# Altium schematic sheet LM386.SchDoc
size A; SheetNumber: 1; SheetTotal: 1
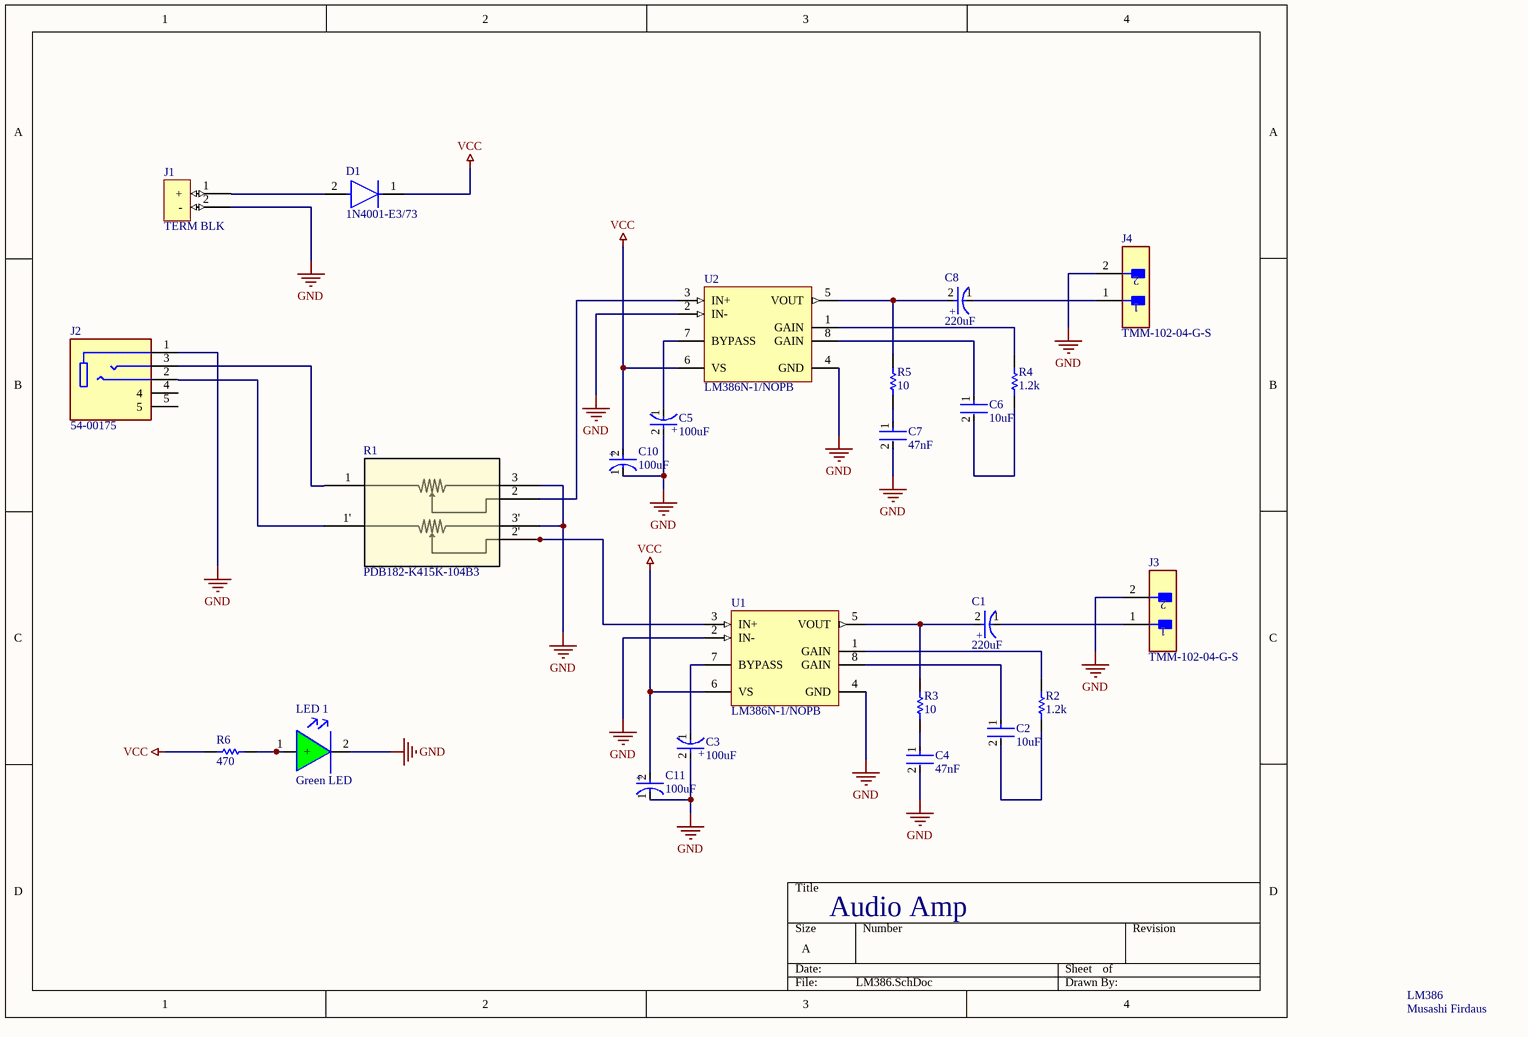
[diagram p0: LM386.SchDoc]

## Parts
C1  220uF  [FP-RAD-TH-D_10_0_5-L_12_5-MFG]
C2  10uF  [FP-RHE2DB-MFG]
C3  100uF  [FP-RAD-TH-D_10_0_5-L_12_5-MFG]
C4  47nF  [FP-RHE2DB-MFG]
C5  100uF  [FP-RAD-TH-D_10_0_5-L_12_5-MFG]
C6  10uF  [FP-RHE2DB-MFG]
C7  47nF  [FP-RHE2DB-MFG]
C8  220uF  [FP-RAD-TH-D_10_0_5-L_12_5-MFG]
C10  100uF  [FP-RAD-TH-D_10_0_5-L_12_5-MFG]
C11  100uF  [FP-RAD-TH-D_10_0_5-L_12_5-MFG]
D1  1N4001-E3/73  [FP-1N4001-E3-73-MFG]
J1  TERM BLK  [Term Block]
J2  54-00175  [TENSILITY_54-00175]
J3  TMM-102-04-G-S  [FP-TMM-102-04-G-S-MFG]
J4  TMM-102-04-G-S  [FP-TMM-102-04-G-S-MFG]
LED_1  Green LED  [Green LED]
R1  PDB182-K415K-104B3  [POT_PDB182_BRN]
R2  1.2k  [RESA60-630X240]
R3  10  [RESA60-630X240]
R4  1.2k  [RESA60-630X240]
R5  10  [RESA60-630X240]
R6  470  [RESA60-630X240]
U1  LM386N-1/NOPB  [P0008A]
U2  LM386N-1/NOPB  [P0008A]

## Nets
GND: C3.2(A) C4.2 C5.2(A) C7.2 C10.1(C) C11.1(C) J1.2(-) J2.1 J3.2 J4.2 LED_1.2(-) R1.3 R1.3' U1.2(IN-) U1.4(GND) U2.2(IN-) U2.4(GND)
VCC: C10.2(A) C11.2(A) D1.1(C) R6.2 U1.6(VS) U2.6(VS)
NetC1_1: C1.1(C) J3.1
NetC1_2: C1.2(A) R3.2 U1.5(VOUT)
NetC2_1: C2.1 U1.8(GAIN)
NetC2_2: C2.2 R2.1
NetC3_1: C3.1(C) U1.7(BYPASS)
NetC4_1: C4.1 R3.1
NetC5_1: C5.1(C) U2.7(BYPASS)
NetC6_1: C6.1 U2.8(GAIN)
NetC6_2: C6.2 R4.1
NetC7_1: C7.1 R5.1
NetC8_1: C8.1(C) J4.1
NetC8_2: C8.2(A) R5.2 U2.5(VOUT)
NetD1_2: D1.2(A) J1.1(+)
NetJ2_2: J2.2 R1.1'
NetJ2_3: J2.3 R1.1
NetLED_1_1: LED_1.1(+) R6.1
NetR1_2: R1.2 U2.3(IN+)
NetR1_2': R1.2' U1.3(IN+)
NetR2_2: R2.2 U1.1(GAIN)
NetR4_2: R4.2 U2.1(GAIN)

Not connected (* = marked no-connect by the designer): J2 4 5

## Notes on the sheet
- Audio Amp
- LM386
- Musashi Firdaus
- (in symbol CMP-05427-001782-1) +

## Library data of the parts
C1 C3 C5 C8 C10 C11 = CMP-05427-001782-1: Aluminum Electrolytic Capacitors (Radial Lead Type) 330uF ±20% 35V; Case/Package: Radial; RoHS Compliant: Yes
C2 C4 C6 C7 = CMP-06035-033660-1: Ceramic Capacitor Automotive 1uF ±10% 50V X8L Radial; Lead Pitch: 2.5mm; Max Operating Temperature: 150°C; Dielectric: X8L; Capacitance: 1uF; Voltage Rating (DC): 50V; Voltage Rating: 50V; Min Operating Temperature: -55°C; REACH SVHC: No SVHC; Tolerance: 10%
D1 = CMP-02540-000001-1: DIODE GEN PURP 50V 1A DO204AL; Manufacturer: Vishay; Max Surge Forward Current: 30A; Value: 15pF; Peak Reverse Current: 5uA; Max Junction Temp: +150°C; Lead Free: Yes; Manufacturer Part Number: 1N4001-E3/73; Height: 2.7mm; Digikey Description: DIODE GEN PURP 50V 1A DO204AL; Reverse Voltage: 50V; Package: 1N4001-E3/73; RoHS: TRUE; Temperature: -50°C to +150°C; Device Class L2: Diodes; Forward Current: 1A; Max Repetitive Reverse Voltage: 50V; Device Class L1: Discrete Semiconductors; Device Class L3: Rectifier Diodes; Capacitance: 15pF; Temperature Range High: +150°C; Category: Diode; Ipc Land Pattern Name: DIOPA1088W105L520D270; ComponentLink2URL: http://www.vishay.com/docs/88503/1n4001.pdf; Octopart: https://octopart.com/1n4001-e3%2F73-vishay-42330130; Automotive: No; ComponentLink2Description: Datasheet; Temperature Range Low: -50°C; Mouser Description: Rectifiers Vr/50V Io/1A
J2 = 54-00175: MF: {'manufacturer': u'Tensility International Corp'}; Package: None; Price: None; Value: *; MP: 54-00175; Availability: Unavailable
J3 J4 = CMP-02766-001609-1: 2MM TERMINAL STRIP; Max Voltage Rating (AC): 500V; Max Current Rating: 3.9A; Number of Contacts: 2; Gender: Male; Length: 4mm; Termination: Solder; Number of Rows: 1; Depth: 1.97mm; RoHS Compliant: Yes; Orientation: Straight; Packaging: Bulk; Pitch: 2mm; Max Operating Temperature: 125°C; Contact Material: Bronze; Radiation Hardening: No; Contact Plating: Gold; Housing Color: Black; Min Operating Temperature: -55°C; Housing Material: Polymer
R1 = PDB182-K415K-104B3: Description; Manufacturer_Name: Bourns Electronics; Copyright: Copyright (C) 2025 Ultra Librarian. All rights reserved.; Manufacturer_Part_Number: PDB182-K415K-104B3; RefDes: RefDes; Type: Type
R2-R6 = CMP-1659-00071-1: Axial Resistor, 100 Ohm, +/- 1%, 0.25 W, -55 to 155 degC, 2-Pin THD, RoHS, Bulk; Voltage Rating: 250 V; Resistance: 4.75 kohm; Power Rating: 250 mW; Type (Resistor): Metal Film; Package Quantity: 200; RoHSCompliant: true; ComponentLink1URL: http://www.yageo.com/; ComponentLink1Description: Manufacturer URL; Case\Package: Axial; ComponentLink2Description: Datasheet; Length: 0.248 inch; PackageReference: MFR-25; Max Operating Temperature: 155 degC; Min Operating Temperature: -55 degC; DatasheetVersion: Apr-13; Mount: Through Hole; PackageDescription: 2-Pin Axial Lead, Dia 2.4 mm, Body Length 6.3 mm; Packaging: Bulk; Tolerance: 1%; ComponentLink2URL: http://www.yageo.com/documents/recent/Yageo%20LR_MFR_2013.pdf
U1 U2 = CMP-0057-00052-4: Low Voltage Audio Power Amplifier, 8-pin MDIP, Pb-Free; Manufacturer: Texas Instruments; PackageTopMarking: NSUZXYTTE#*LM*386N-1; PowerWise: N; CompType: Audio IC; RoHS: Y; PackageReference: P0008A; Code_JEDEC: MS-001-BA; PackageDescription: MDIP, .365 x .250 x .130in, 8 Lead, .100in Pitch; PinCount: 8; ComponentLink1URL: http://www.ti.com/general/docs/lit/getliterature.tsp?genericPartNumber=LM386&fileType=pdf; ComponentLink1Description: Datasheet URL